# Altium schematic sheet Digital-Input-Sheet.SchDoc
size 420 x 297 mm; SheetNumber: 6; SheetTotal: 8
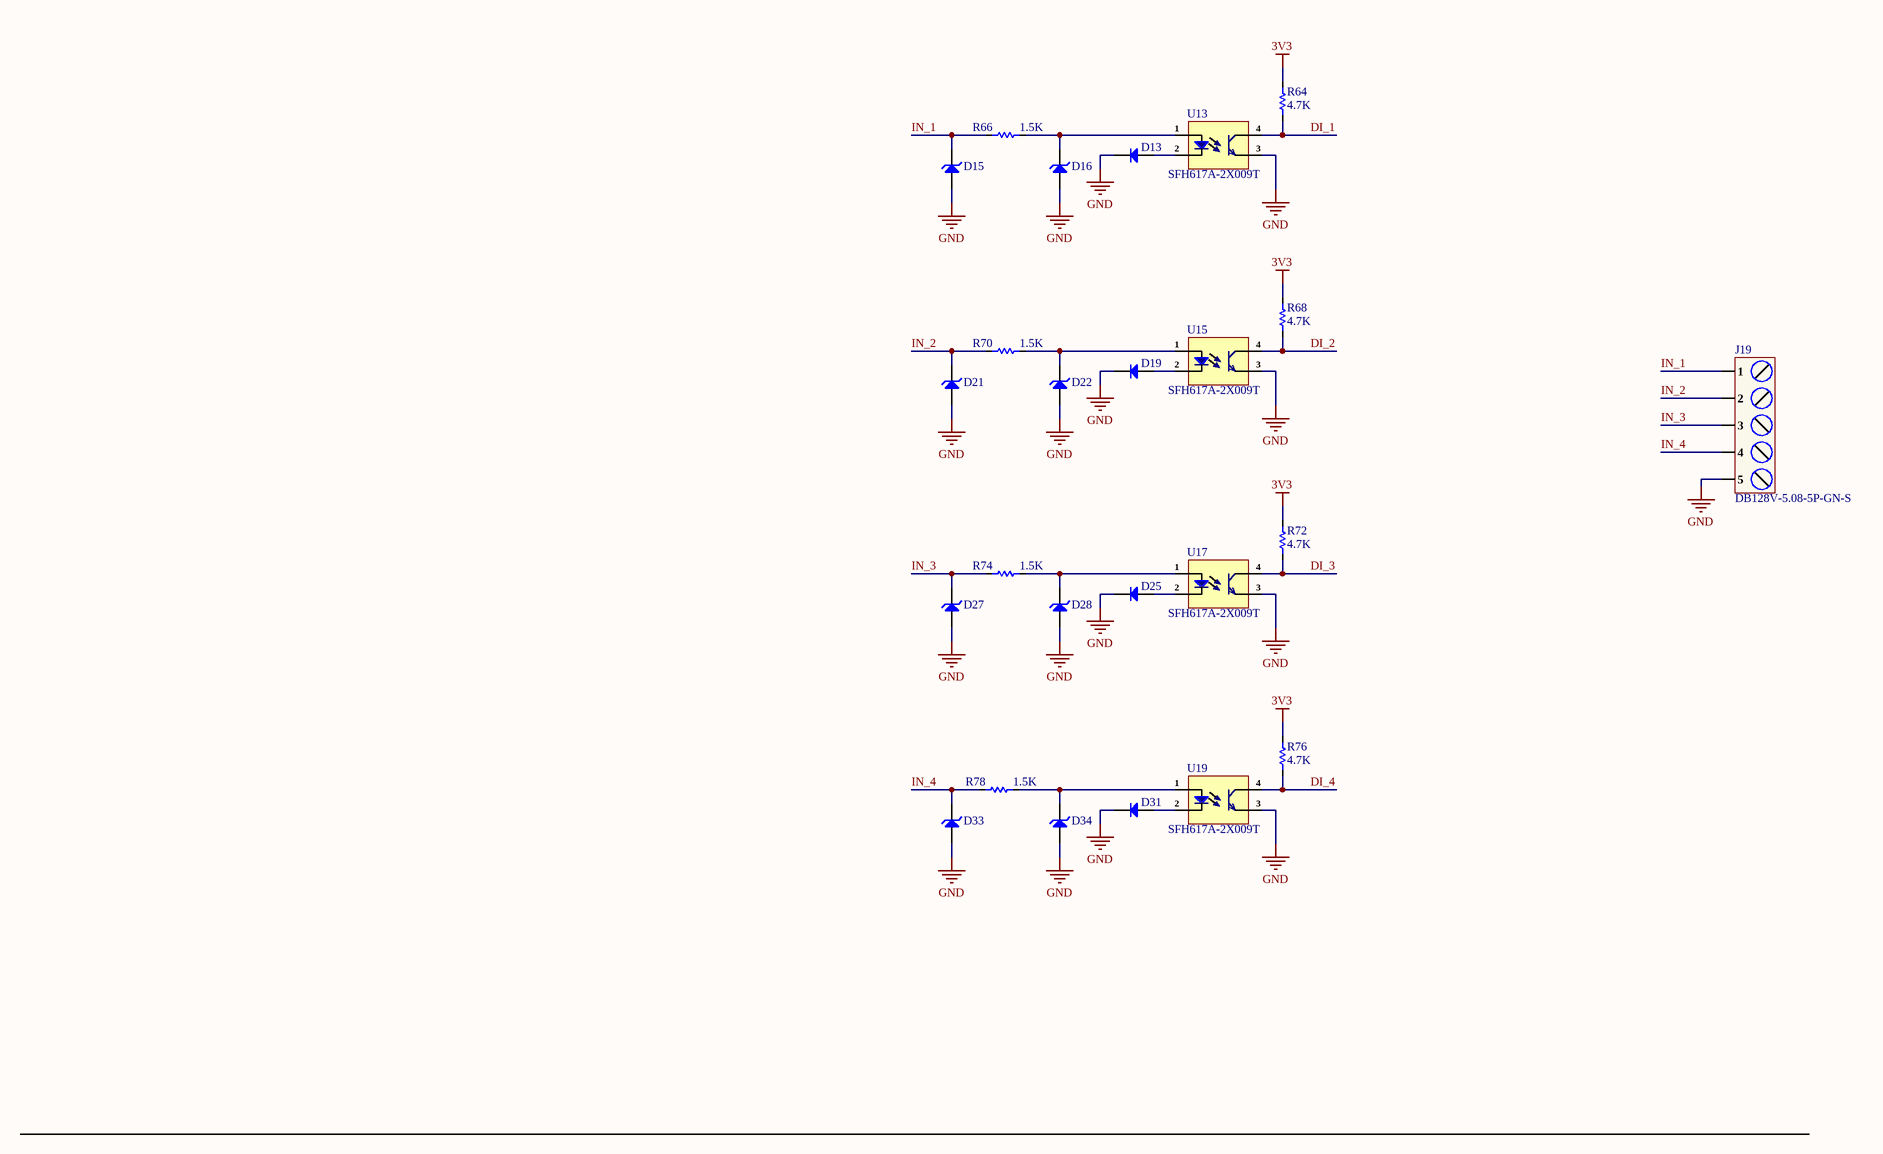
[diagram p0: Digital-Input-Sheet.SchDoc]

## Parts
D13  1N4148W-7-F  [SOD-123]  (value not drawn)
D15  AZ4024-01G  [SOD-123]  (value not drawn)
D16  BZT52C24  [SOD-123]  (value not drawn)
D19  1N4148W-7-F  [SOD-123]  (value not drawn)
D21  AZ4024-01G  [SOD-123]  (value not drawn)
D22  BZT52C24  [SOD-123]  (value not drawn)
D25  1N4148W-7-F  [SOD-123]  (value not drawn)
D27  AZ4024-01G  [SOD-123]  (value not drawn)
D28  BZT52C24  [SOD-123]  (value not drawn)
D31  1N4148W-7-F  [SOD-123]  (value not drawn)
D33  AZ4024-01G  [SOD-123]  (value not drawn)
D34  BZT52C24  [SOD-123]  (value not drawn)
J19  DB128V-5.08-5P-GN-S  [DB128V-5.08-5P-GN-S]
R64  4.7K  [Res-0402]
R66  1.5K  [Res-0603]
R68  4.7K  [Res-0402]
R70  1.5K  [Res-0603]
R72  4.7K  [Res-0402]
R74  1.5K  [Res-0603]
R76  4.7K  [Res-0402]
R78  1.5K  [Res-0603]
U13  SFH617A-2X009T  [SFH617A-2X009T]
U15  SFH617A-2X009T  [SFH617A-2X009T]
U17  SFH617A-2X009T  [SFH617A-2X009T]
U19  SFH617A-2X009T  [SFH617A-2X009T]

## Nets
3V3: R64.2 R68.2 R72.2 R76.2
GND: D13.2(K) D15.1(A) D16.1(A) D19.2(K) D21.1(A) D22.1(A) D25.2(K) D27.1(A) D28.1(A) D31.2(K) D33.1(A) D34.1(A) J19.5 U13.3(E) U15.3(E) U17.3(E) U19.3(E)
DI_1: R64.1 U13.4(C)
DI_2: R68.1 U15.4(C)
DI_3: R72.1 U17.4(C)
DI_4: R76.1 U19.4(C)
IN_1: D15.2(K) J19.1 R66.1
IN_2: D21.2(K) J19.2 R70.1
IN_3: D27.2(K) J19.3 R74.1
IN_4: D33.2(K) J19.4 R78.1
NetD13_1: D13.1(A) U13.2(Ca)
NetD16_2: D16.2(K) R66.2 U13.1(An)
NetD19_1: D19.1(A) U15.2(Ca)
NetD22_2: D22.2(K) R70.2 U15.1(An)
NetD25_1: D25.1(A) U17.2(Ca)
NetD28_2: D28.2(K) R74.2 U17.1(An)
NetD31_1: D31.1(A) U19.2(Ca)
NetD34_2: D34.2(K) R78.2 U19.1(An)

## Notes on the sheet
- File:
- Title:
- Date:
- Page
- Num:
- Total:
- Drawn By: Huzaifa Ali

## Library data of the parts
D13 D19 D25 D31 = 1N4148W-7-F: DIODE GEN PURP 100V 300MA SOD123; Manufacturer: Diodes; Forward Current: 150mA; Reverse Recovery Time: 4ns; Max Forward Surge Current (Ifsm): 2A; Element Configuration: Single; Max Reverse Current: 1uA; Forward Voltage: 1.25V; Power Dissipation: 400mW; Polarity: Standard; Voltage Rating (DC): 75V; Value: 2pF; Supplier 1: Future Electronics; Manufacturer Part Number: 1N4148W-7-F; RoHS: Yes; Category: Rectifier Diodes; Stock 1: 32931000; Pricing 1: 3000=0.01840, 12000=0.01760, 45000=0.01690, 120000=0.01640, 300000=0.01560 (USD); Mounting Technology: Surface Mount; Pins: 2; Weight: 0.000353oz; Contact Plating: Tin,Matte; Min Operating Temperature: -65°C; Max Operating Temperature: 150°C; Packaging: Tape and Reel; Max Repetitive Reverse Voltage (Vrrm): 100V; Peak Non-Repetitive Surge Current: 2A; Voltage: 100V; Max Surge Current: 2A; Package Quantity: 3000; Recovery Time: 4ns; Average Rectified Current: 300mA; Power Rating: 400mW; Current Rating: 150mA; Output Current: 150mA; Max Reverse Voltage (DC): 100V; Series: -; Reverse Recovery Time-Max: 4ns; Length: 2.85mm; Width: 1.7mm; Height: 1.25mm; Radiation Hardening: No; RoHS Compliant: Yes; Reach SVHC Compliant: Yes; Lead Free: Lead Free; ComponentLink1URL: https://datasheet.ciiva.com/1179/1915529-1179304.pdf?src-supplier=Element14; ComponentLink1Description: https://datasheet.ciiva.com/1179/1915529-1179304.pdf?src-supplier=Element14; ComponentLink2URL: https://datasheet.ciiva.com/22695/1915529-22695239.pdf?src-supplier=Element14; ComponentLink2Description: https://datasheet.ciiva.com/22695/1915529-22695239.pdf?src-supplier=Element14; ComponentLink3URL: https://datasheet.ciiva.com/8300/ds30086-8300392.pdf?src-supplier=Avnet; ComponentLink3Description: https://datasheet.ciiva.com/8300/ds30086-8300392.pdf?src-supplier=Avnet; ComponentLink4URL: https://datasheet.ciiva.com/15219/getdatasheetpartid-110030-15219548.pdf?src-supplier=Verical; ComponentLink4Description: https://datasheet.ciiva.com/15219/getdatasheetpartid-110030-15219548.pdf?src-supplier=Verical; ComponentLink5URL: https://datasheet.ciiva.com/8303/ds30086-8303197.pdf?src-supplier=Avnet; ComponentLink5Description: https://datasheet.ciiva.com/8303/ds30086-8303197.pdf?src-supplier=Avnet; ComponentLink6URL: https://datasheet.ciiva.com/911/ds30086-911735.pdf?src-supplier=Digi-Key; ComponentLink6Description: https://datasheet.ciiva.com/911/ds30086-911735.pdf?src-supplier=Digi-Key; ComponentLink7URL: https://datasheet.ciiva.com/911/ds30086-911736.pdf?src-supplier=Digi-Key; ComponentLink7Description: https://datasheet.ciiva.com/911/ds30086-911736.pdf?src-supplier=Digi-Key; ComponentLink8URL: https://datasheet.ciiva.com/911/ds30086-911734.pdf?src-supplier=Digi-Key; ComponentLink8Description: https://datasheet.ciiva.com/911/ds30086-911734.pdf?src-supplier=Digi-Key; ComponentLink9URL: https://datasheet.ciiva.com/4435/ds30086-4435128.pdf?src-supplier=Mouser; ComponentLink9Description: https://datasheet.ciiva.com/4435/ds30086-4435128.pdf?src-supplier=Mouser; Supplier Part Number 1: 7634694; LCSC Part Number: C83528; Item Type: Diode
D15 D21 D27 D33 = AZ4024-01G: 26.7V 24V SOD-123 ESD and Surge Protection (TVS/ESD) ROHS; Manufacturer: AMAZING; Manufacturer Part Number: AZ4024-01G; Package: SOD-123; LCSC Part Number: C5571859; Item Type: (TVS/ESD); ComponentLink1Description: LCSC; ComponentLink1URL: https://www.lcsc.com/product-detail/ESD-and-Surge-Protection-TVS-ESD_AMAZING-AZ4024-01G_C5571859.html
D16 D22 D28 D34 = BZT52C24: Independent Type 22.8V~25.6V 500mW 24V SOD-123 Zener Diodes ROHS; Manufacturer: BORN; Manufacturer Part Number: BZT52C24; Package: SOD-123; LCSC Part Number: C266572; Item Type: Zener Diode
J19 = DB128V-5.08-5P-GN-S: 1x5P 20A -40℃~+105℃ 300V Green 12~30 Direct Insert 5.08mm 2.5 1 5 Plugin,P=5.08mm Screw Terminal Blocks ROHS; Manufacturer: DORABO; Manufacturer Part Number: DB128V-5.08-5P-GN-S; Package: Plugin,P=5.08mm; LCSC Part Number: C2927513; ComponentLink1Description: LCSC; ComponentLink1URL: https://www.lcsc.com/product-detail/Screw-Terminal-Blocks_DORABO-DB128V-5-08-5P-GN-S_C2927513.html; Item Type: Terminal Block
R64 R68 R72 R76 = RC0402FR-074K7L: RES 4.7K OHM 1% 1/16W 0402; Manufacturer: Yageo; Voltage Rating (DC): 50V; Power Rating: 62.5mW; Resistance: 4.7kR; Temperature Coefficient: 100ppm/°C; Max Power Dissipation: 63mW; Item Type: Resistor; Supplier 1: Avnet; Manufacturer Part Number: RC0402FR-074K7L; RoHS: Yes; Category: Chip SMD Resistors; Stock 1: 2420000; Pricing 1: 10000=0.00085 (USD); Case/Package: 0402; Number of Pins: 2; Case Code (Imperial): 0402; Case Code (Metric): 1005; Size Code: 0402; Min Operating Temperature: -55°C; Max Operating Temperature: 155°C; Tolerance: 1%; Voltage Rating: 50V; Packaging: Tape and Reel; Resistor Type: Thick Film; Termination: SMD/SMT; Features: Moisture Resistant; Series: RC; Number of Terminations: 2; Resistance Tolerance: 1%; Construction: Rectangular; Length: 1mm; Width: 0.5mm; Height: 0.32mm; Depth: 0.5mm; Height - Seated (Max): 0.016inch; RoHS Compliant: Yes; Reach SVHC Compliant: Yes; Military Standard: Not; Lead Free: Lead Free; ComponentLink1URL: https://datasheet.ciiva.com/22661/1686128-22661342.pdf?src-supplier=Element14; ComponentLink1Description: https://datasheet.ciiva.com/22661/1686128-22661342.pdf?src-supplier=Element14; ComponentLink2URL: https://datasheet.ciiva.com/7850/1018594-7850022.pdf?src-supplier=Element14; ComponentLink2Description: https://datasheet.ciiva.com/7850/1018594-7850022.pdf?src-supplier=Element14; ComponentLink3URL: https://datasheet.ciiva.com/7850/1018594-7850023.pdf?src-supplier=Element14; ComponentLink3Description: https://datasheet.ciiva.com/7850/1018594-7850023.pdf?src-supplier=Element14; ComponentLink4URL: https://datasheet.ciiva.com/15215/getdatasheetpartid-328119-15215035.pdf?src-supplier=Verical; ComponentLink4Description: https://datasheet.ciiva.com/15215/getdatasheetpartid-328119-15215035.pdf?src-supplier=Verical; Supplier Part Number 1: RC0402FR-074K7L; LCSC Part Number: C105871
R66 R70 R74 R78 = RC0603FR-071K5L: RES 1.5K OHM 1% 1/10W 0603; Manufacturer: Yageo; Voltage Rating (DC): 50V; Resistance: 1.5kR; Temperature Coefficient: 100ppm/°C; Power Rating: 100mW; Item Type: Resistor; Supplier 1: Arrow Electronics; Manufacturer Part Number: RC0603FR-071K5L; RoHS: Yes; Category: Chip SMD Resistors; Stock 1: 15000; Pricing 1: 1=0.00160, 5000=0.00160 (USD); Case/Package: 0603; Number of Pins: 2; Case Code (Metric): 1608; Case Code (Imperial): 0603; Size Code: 0603; Min Operating Temperature: -55°C; Max Operating Temperature: 155°C; Tolerance: 1%; Packaging: Tape and Reel; Resistor Type: Thick Film; Voltage Rating: 50V; Package Quantity: 1; Number of Terminations: 2; Termination: SMD/SMT; Max Power Dissipation: 100mW; Features: Moisture Resistant; Series: RC; Resistance Tolerance: 1%; Construction: Rectangular; Length: 0.063inch; Width: 0.031inch; Height: 0.022inch; Depth: 0.8mm; REACH SVHC: No SVHC; Lead Free: Lead Free; Military Standard: Not; RoHS Compliant: Yes; Supplier Part Number 1: RC0603FR-071K5L; LCSC Part Number: C114668
U13 U15 U17 U19 = SFH617A-2X009T: OPTOISOLATOR 5.3KV TRANS 4SMD; Manufacturer: Vishay; Item Type: IC; Supplier: Arrow Electronics; LCSC Part Number: C5334420; Manufacturer Part Number: SFH617A-2X009T; RoHS: Yes; Stock: 871; Pricing: 1=0.3234, 10=0.3216, 25=0.3197, 100=0.3179, 250=0.3161, 500=0.3142 (USD); ComponentLink1URL: https://datasheet.ciiva.com/18616/options-18616575.pdf?src-supplier=Digikey; ComponentLink1Description: https://datasheet.ciiva.com/18616/options-18616575.pdf?src-supplier=Digikey